# Altium schematic sheet Sheet4.SchDoc
size A; SheetNumber: 4; SheetTotal: 7; SPICEModelCacheHPEEUEEV: <root> / <DocumentId>HPEEUEEV</DocumentId> / <CacheFrame Number="0"> / <Model Name="860010274012_560uf" Kind="CKT"> / <Text>******* / .subckt 860010274012_560uF 1 2 / Rser 1 3 0.163 / Lser 2 4 0.000000024 / C1 3 4 0.00056 / Rpar 3 4 178571.428571429 / .ends 860010274012_560uF</Text> / </Model> / <Model Name="860010275016_1mf" Kind="CKT"> / <Text>******* / .subckt 860010275016_1mF 1 2 / Rser 1 3 0.145 / Lser 2 4 0.0000000269 / C1 3 4 0.001 / Rpar 3 4 100000 / .ends 860010275016_1mF</Text> / </Model> / <Model Name="7345_744777001_1u" Kind="CKT"> / <Text>******* / .subckt 7345_744777001_1u 1 2 / Rp 1 2 2428.067211 / Cp 1 2 3.37078710741p / Rs 1 N3 0.0084 / L1 N3 2 0.888631308826u / .ends 7345_744777001_1u</Text> / </Model> / </CacheFrame> / </root>
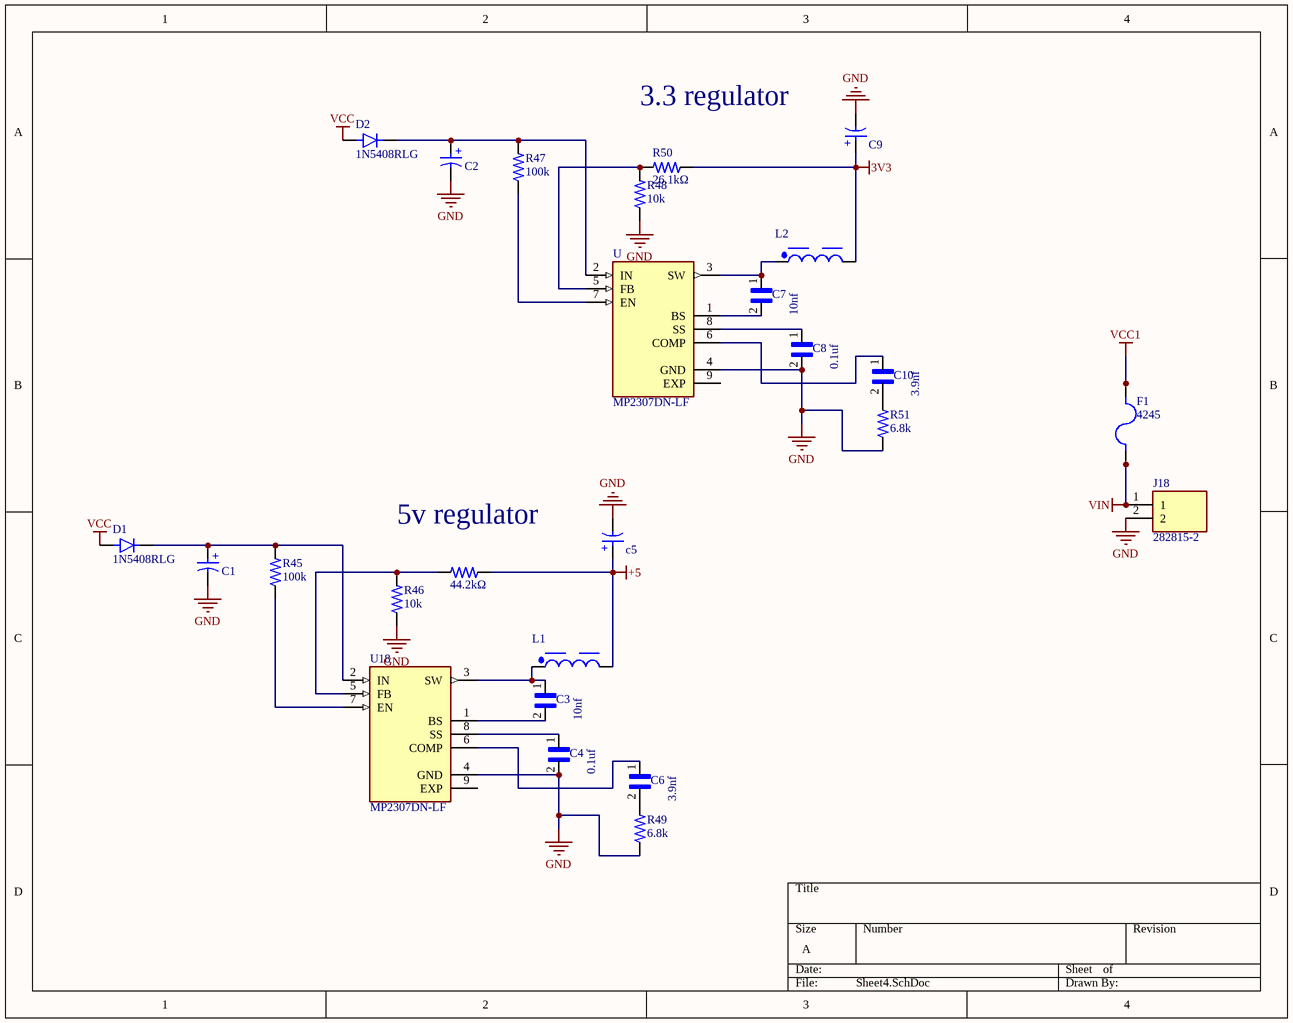
[diagram p0: Sheet4.SchDoc]

## Parts
?  44.2kΩ  [RESC2012X65N]
C1  1000uF  [WCAP-ATG8_D10H12.5]  (value not drawn)
C2  1000uF  [WCAP-ATG8_D10H12.5]  (value not drawn)
C3  10nf  [CAPC2012X135N]
C4  0.1uf  [CAPC2012X135N]
c5  100uf  [WCAP-ATG8_D8H11.5]  (value not drawn)
C6  3.9nf  [CAPC2012X135N]
C7  10nf  [CAPC2012X135N]
C8  0.1uf  [CAPC2012X135N]
C9  100uf  [WCAP-ATG8_D8H11.5]  (value not drawn)
C10  3.9nf  [CAPC2012X135N]
D1  1N5408RLG  [DIOAD1990W125L900D530]
D2  1N5408RLG  [DIOAD1990W125L900D530]
F1  4245  [FUSE_4245]
J18  282815-2  [TE_282815-2]
L1  1 μH, 6.84 A  [WE-PD_7345]  (value not drawn)
L2  1 μH, 6.84 A  [WE-PD_7345]  (value not drawn)
R45  100k  [RESC2012X65N]
R46  10k  [RESC2012X65N]
R47  100k  [RESC2012X65N]
R48  10k  [RESC2012X65N]
R49  6.8k  [RESC2012X65N]
R50  26.1kΩ  [RESC2012X65N]
R51  6.8k  [RESC2012X65N]
U  MP2307DN-LF  [SOIC127P600X170-9N]
U18  MP2307DN-LF  [SOIC127P600X170-9N]

## Nets
3V3: C9.1(P) L2.2 R50.1
+5: ?.1 c5.1(P) L1.2
GND: C1.2(N) C2.2(N) C4.2 c5.2(N) C8.2 C9.2(N) J18.2 R46.1 R48.1 R49.1 R51.1 U.4(GND) U18.4(GND)
VCC: D1.A D2.A
VCC1: F1.2_1 F1.2_2
VIN: F1.1_1 F1.1_2 J18.1
Net?_2: ?.2 R46.2 U18.5(FB)
NetC1_1: C1.1(P) D1.C(K) R45.2 U18.2(IN)
NetC2_1: C2.1(P) D2.C(K) R47.2 U.2(IN)
NetC3_1: C3.1 L1.1 U18.3(SW)
NetC3_2: C3.2 U18.1(BS)
NetC4_1: C4.1 U18.8(SS)
NetC6_1: C6.1 U18.6(COMP)
NetC6_2: C6.2 R49.2
NetC7_1: C7.1 L2.1 U.3(SW)
NetC7_2: C7.2 U.1(BS)
NetC8_1: C8.1 U.8(SS)
NetC10_1: C10.1 U.6(COMP)
NetC10_2: C10.2 R51.2
NetR45_1: R45.1 U18.7(EN)
NetR47_1: R47.1 U.7(EN)
NetR48_2: R48.2 R50.2 U.5(FB)

Not connected (* = marked no-connect by the designer): U 9(EXP); U18 9(EXP)

## Notes on the sheet
- (near C9) 3.3 regulator
- 5v regulator
- (in symbol 860010274012) +
- (in symbol 860010275016) +

## Library data of the parts
? R45-R51 = CRG0805F33R: Fixed Resistors; MF: TE Connectivity; Price: None; MP: CRG0805F33R; Package: 0805; Value: *; Purchase-URL: https://pricing.snapeda.com/search/part/CRG0805F33R/?ref=eda; Check_prices: https://www.snapeda.com/parts/CRG0805F33R/TE+Connectivity+Passive+Product/view-part/?ref=eda; Availability: In Stock; EU_RoHS_Compliance: Compliant with Exemptions; SnapEDA_Link: https://www.snapeda.com/parts/CRG0805F33R/TE+Connectivity+Passive+Product/view-part/?ref=snap
C1 C2 = 860010275016: WCAP-ATG8 Aluminum Electrolytic Capacitor, Radial, THT, D10 x H12.5mm, 1000uF, 10V; Manufacturer: Wurth Elektronik; Capacitance Tolerance: +/-20%; Dissipation Factor: 19%; Endurance: 2000h; Leakage Current: 100uA; Ripple Current: 726mA; Technical Reference: ATBF125102M010DSPA9B000; Manufacturer Part Number: 860010275016; Category: Aluminum Electrolytic Capacitors; Match Code: WCAP-ATG8; ComponentLink1Description: Website Link; ComponentLink1URL: https://www.we-online.com/redexpert/article/860010275016?ad; ComponentLink2Description: Datasheet Link; ComponentLink2URL: https://www.we-online.com/redexpert/spec/860010275016?ad; Mount: Through Hole; Operating Temperature Max: 85°C; Operating Temperature Min: -40°C; Packaging: Ammo Pack; Height: 12.5mm; Diameter: 10mm; Capacitance: 1000uF; Rated Voltage (DC): 10V
C3 C4 C6-C8 C10 = GCM2165C2A151JA16D: Cap Ceramic 150pF 100V C0G 5% Pad SMD 0805 125Â°C Automotive T/R; Package: None; Price: None; Value: *; MP: GCM2165C2A151JA16D; Availability: Unavailable
c5 C9 = 860010274012: WCAP-ATG8 Aluminum Electrolytic Capacitor, Radial, THT, D8 x H11.5mm, 560uF, 10V; Manufacturer: Wurth Elektronik; Capacitance Tolerance: +/-20%; Dissipation Factor: 19%; Endurance: 2000h; Leakage Current: 56uA; Ripple Current: 506mA; Technical Reference: ATBE115561M010DSPA7B000; Manufacturer Part Number: 860010274012; Category: Aluminum Electrolytic Capacitors; Match Code: WCAP-ATG8; ComponentLink1Description: Website Link; ComponentLink1URL: https://www.we-online.com/redexpert/article/860010274012?ad; ComponentLink2Description: Datasheet Link; ComponentLink2URL: https://www.we-online.com/redexpert/spec/860010274012?ad; Mount: Through Hole; Operating Temperature Max: 85°C; Operating Temperature Min: -40°C; Packaging: Ammo Pack; Height: 11.5mm; Diameter: 8mm; Capacitance: 560uF; Rated Voltage (DC): 10V
D1 D2 = 1N5408RLG: Diodo estÃ¡ndar 1000 V 3 A orificio pasante DO-201AD; MF: ON Semiconductor; SnapEDA_Link: https://www.snapeda.com/parts/1N5408RLG/Onsemi/view-part/?ref=snap; Package: AXIAL LEAD-2 ON Semiconductor; Value: *; MP: 1N5408RLG; Check_prices: https://www.snapeda.com/parts/1N5408RLG/Onsemi/view-part/?ref=eda
F1 = 4245: Fuse Holder, THM, Press-Fit, 1 Fuse, Fuse Size 3AG, 15 A, PBT/Brass-Tin | Keystone Electronics 4245; SnapEDA_Link: https://www.snapeda.com/parts/4245/Keystone/view-part/?ref=snap; Package: None; Value: *; MF: Keystone Electronics; MP: 4245; Check_prices: https://www.snapeda.com/parts/4245/Keystone/view-part/?ref=eda
J18 = 282815-2: 2 Position Terminal Block Header, Male Pins, Shrouded (2 Side) 0.200 (5.08mm) 90Â°, Right Angle - Through Hole; MF: TE Connectivity; SnapEDA_Link: https://www.snapeda.com/parts/282815-2/TE+Connectivity+AMP+Connectors/view-part/?ref=snap; Package: None; Value: *; MP: 282815-2; EU_RoHS_Compliance: Compliant with Exemptions; Check_prices: https://www.snapeda.com/parts/282815-2/TE+Connectivity+AMP+Connectors/view-part/?ref=eda
L1 L2 = 744777001: WE-PD SMT Power Inductor, size 7345, 1 μH, 6.84 A, 10 mΩ; Manufacturer: Wurth Elektronik; Case/Size Code: 7345; DC Resistance: 8.4 mΩ; DC Resistance Max: 10 mΩ; Inductance: 1 μH; Rated Current: 6.84 A; Saturation Current: 10.2 A; Self Resonant Frequency: 100 MHz; Type: Standard; Manufacturer Part Number: 744777001; Category: Power Inductors; Match Code: WE-PD; ComponentLink1Description: Website Link; ComponentLink1URL: https://www.we-online.com/redexpert/article/744777001?ad; ComponentLink2Description: Datasheet Link; ComponentLink2URL: https://www.we-online.com/redexpert/spec/744777001?ad; Mount: Surface Mount; Min Operating Temperature: -40 °C; Max Operating Temperature: 125 °C; Packaging: Tape and Reel; Length: 7.3 mm; Width: 7.3 mm; Height: 4.5 mm
U U18 = MP2307DN-LF: Buck Switching Regulator IC Positive Adjustable 0.925V 1 Output 3A 8-SOIC _0.154, 3.90mm Width_ Exposed Pad; MF: Monolithic Power; Availability: Unavailable; Price: None; Package: SOIC-8 Monolithic Power Systems; MP: MP2307DN-LF; Value: *; SnapEDA_Link: https://www.snapeda.com/parts/MP2307DN-LF/Monolithic%20Power%20Systems%20Inc./view-part/424671/?ref=snap